# Altium schematic sheet Motor_Encoder_Sheet.SchDoc
size 420 x 297 mm; SheetNumber: 4; SheetTotal: 5
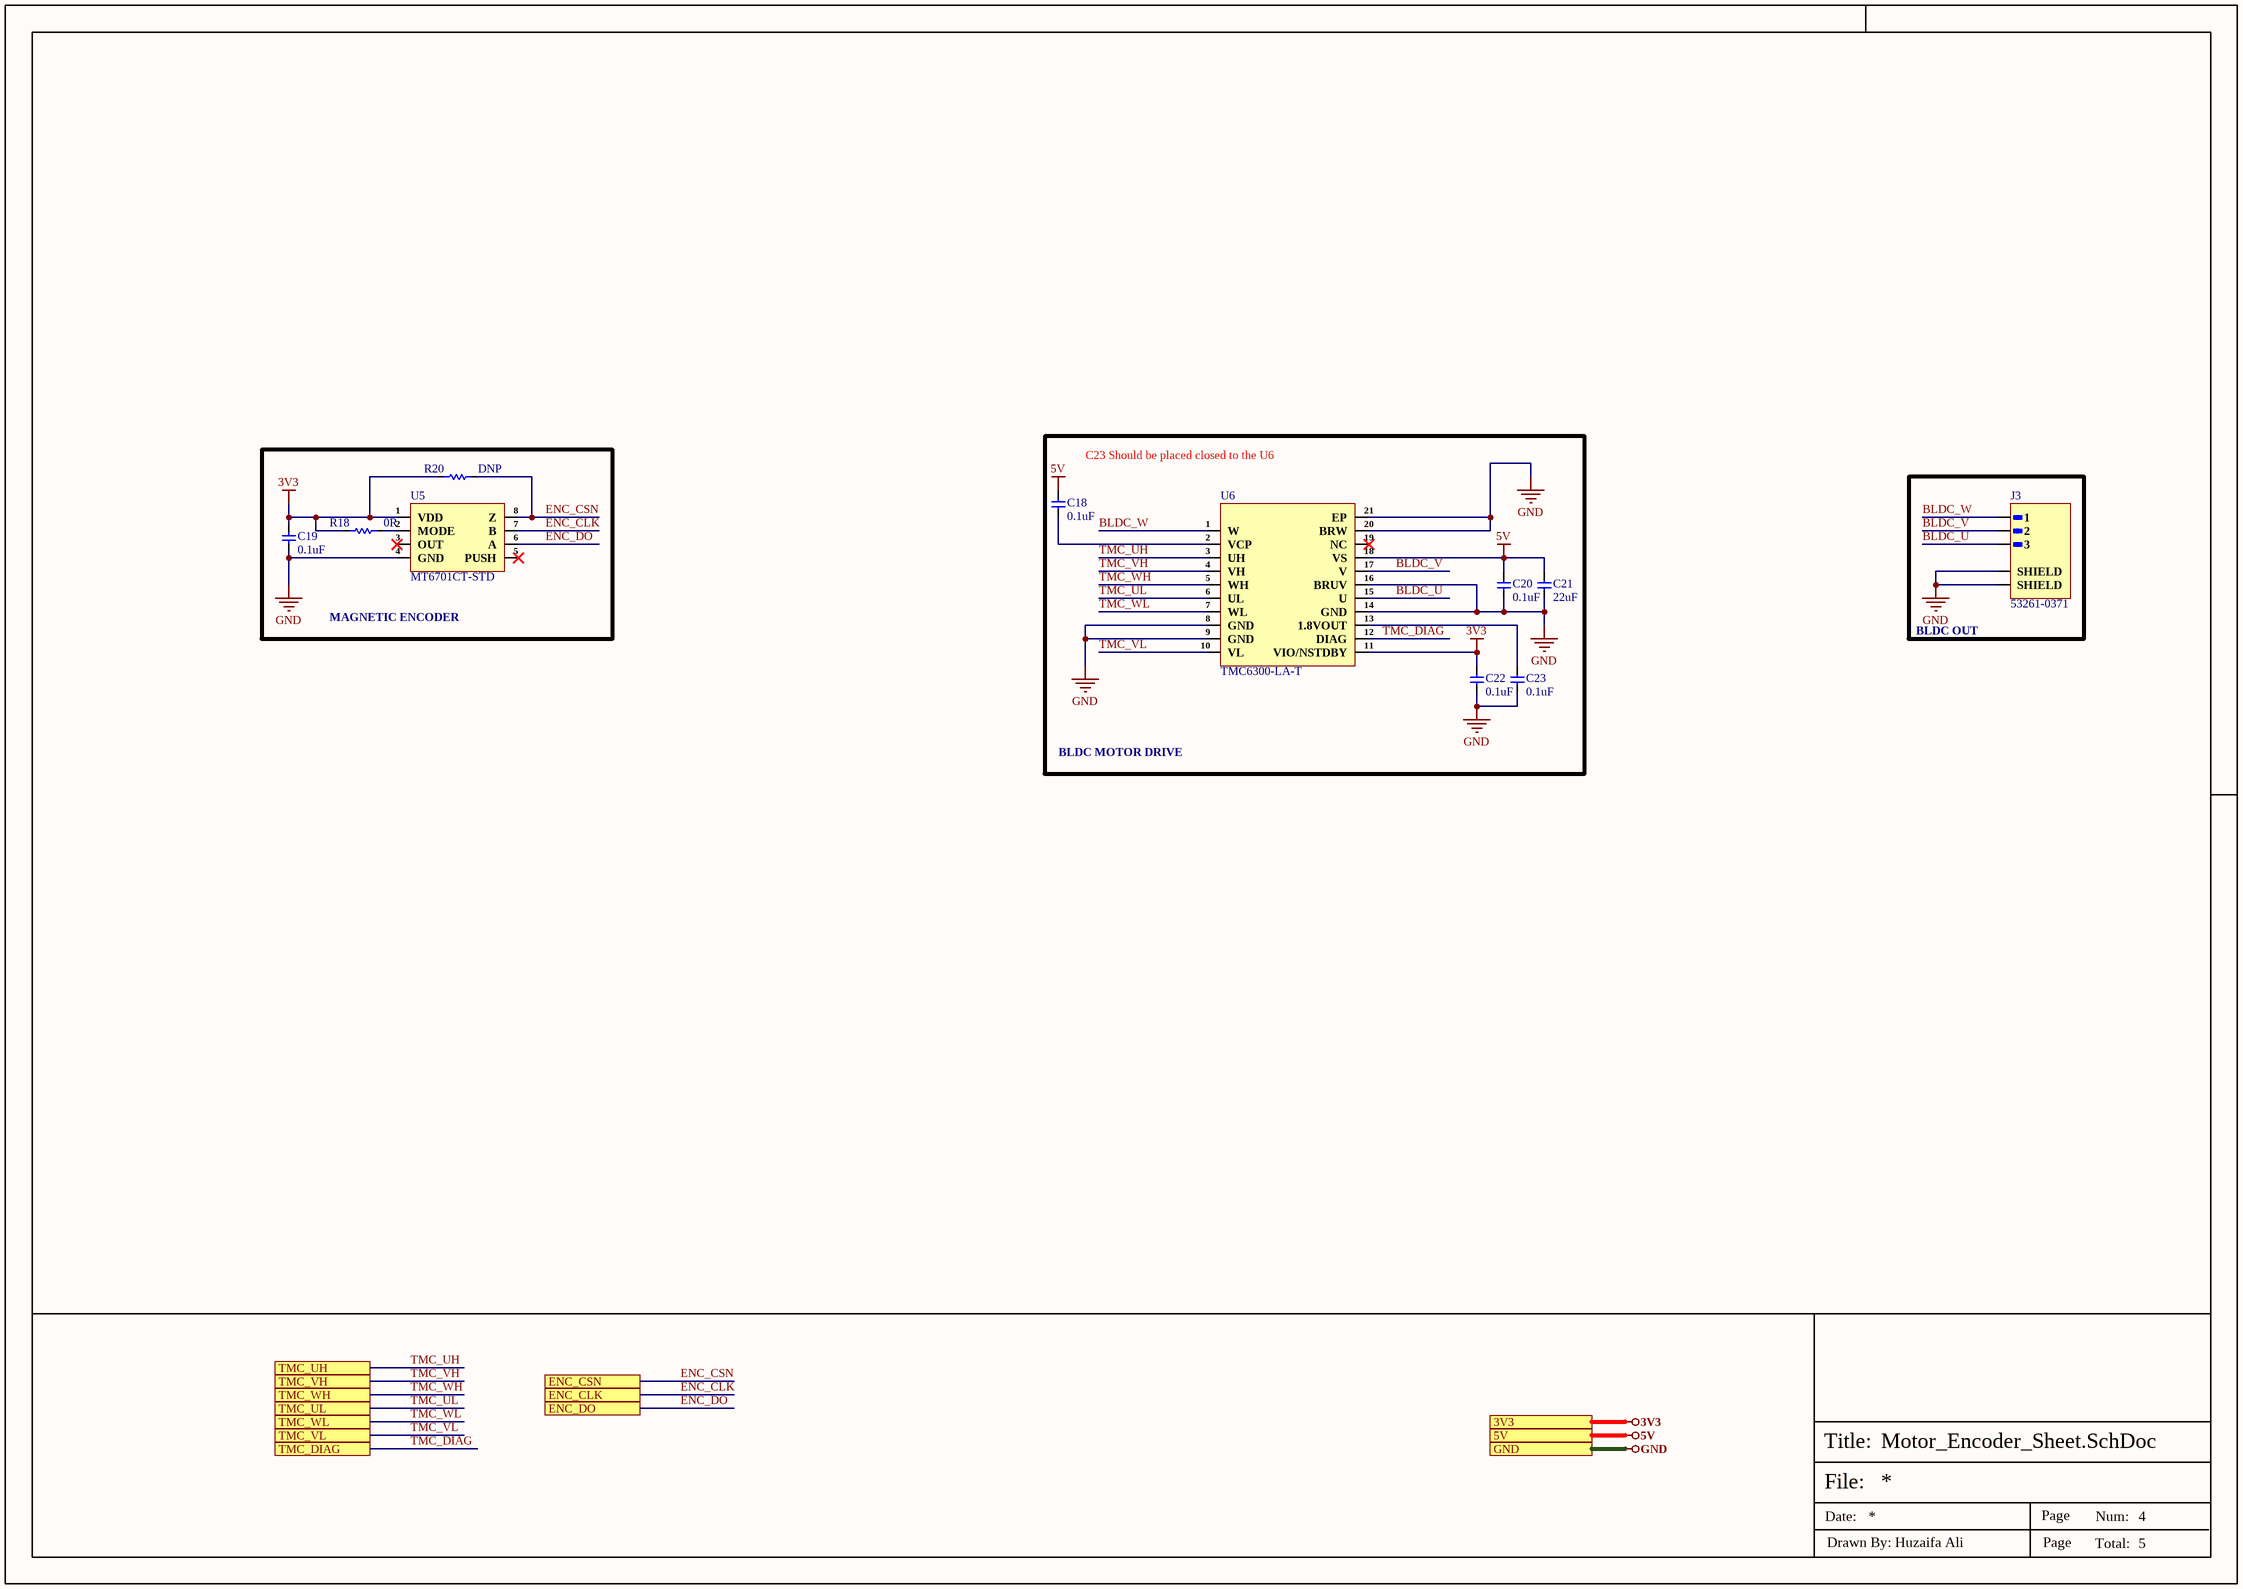
[diagram p0: Motor_Encoder_Sheet.SchDoc]

## Parts
C18  0.1uF  [Cap-0402]
C19  0.1uF  [Cap-0402]
C20  0.1uF  [Cap-0402]
C21  22uF  [Cap-1210]
C22  0.1uF  [Cap-0402]
C23  0.1uF  [Cap-0402]
J3  53261-0371  [53261-0371]
R18  0R  [Res-0603]
R20  DNP  [Res-0603]
U5  MT6701CT-STD  [SOP-8]
U6  TMC6300-LA-T  [20-QFN(3x3)]

## Blocks framed on the sheet
MAGNETIC ENCODER: C19 R18 R20 U5
BLDC OUT: J3

## Ports
3V3 (see Top_Sheet[4B], Controller_Sheet[4D], Power_Sheet[3D], RGB_LED_Sheet[4D]), 5V (see Top_Sheet[4B], Controller_Sheet[4D], Power_Sheet[3D], RGB_LED_Sheet[4D]), ENC_CLK (see Top_Sheet[4C], Controller_Sheet[2D]), ENC_CSN (see Top_Sheet[4C], Controller_Sheet[2D]), ENC_DO (see Top_Sheet[4C], Controller_Sheet[2D]), GND (see Top_Sheet[4B], Controller_Sheet[4D], Power_Sheet[3D], RGB_LED_Sheet[4D]), TMC_DIAG (see Top_Sheet[4B], Controller_Sheet[1D]), TMC_UH (see Top_Sheet[4B], Controller_Sheet[1D]), TMC_UL (see Top_Sheet[4C], Controller_Sheet[1D]), TMC_VH (see Top_Sheet[4B], Controller_Sheet[1D]), TMC_VL (see Top_Sheet[4C], Controller_Sheet[1D]), TMC_WH (see Top_Sheet[4C], Controller_Sheet[1D]), TMC_WL (see Top_Sheet[4C], Controller_Sheet[1D])

## Nets
3V3: C19.2 C22.2 R18.1 R20.1 U5.1(VDD) U6.11(VIO/NSTDBY) ; port 3V3
5V: C18.2 C20.2 C21.2 U6.18(VS) ; port 5V
GND: C19.1 C20.1 C21.1 C22.1 C23.1 J3.SH1(SHIELD) J3.SH2(SHIELD) U5.4(GND) U6.8(GND) U6.9(GND) U6.14(GND) U6.16(BRUV) U6.20(BRW) U6.21(EP) ; port GND
BLDC_U: J3.3 U6.15(U)
BLDC_V: J3.2 U6.17(V)
BLDC_W: J3.1 U6.1(W)
ENC_CLK: U5.7(B) ; port ENC_CLK
ENC_CSN: R20.2 U5.8(Z) ; port ENC_CSN
ENC_DO: U5.6(A) ; port ENC_DO
TMC_DIAG: U6.12(DIAG) ; port TMC_DIAG
TMC_UH: U6.3(UH) ; port TMC_UH
TMC_UL: U6.6(UL) ; port TMC_UL
TMC_VH: U6.4(VH) ; port TMC_VH
TMC_VL: U6.10(VL) ; port TMC_VL
TMC_WH: U6.5(WH) ; port TMC_WH
TMC_WL: U6.7(WL) ; port TMC_WL
NetC18_1: C18.1 U6.2(VCP)
NetC23_2: C23.2 U6.13(1.8VOUT)
NetR18_2: R18.2 U5.2(MODE)

Not connected (* = marked no-connect by the designer): U5 3(OUT)* 5(PUSH)*; U6 19(NC)*

## Notes on the sheet
- C23 Should be placed closed to the U6
- BLDC MOTOR DRIVE
- File:
- Title:
- Date:
- Page
- Num:
- Total:
- Drawn By: Huzaifa Ali

## Library data of the parts
C18-C20 C22 C23 = GRM155R71E104KE14D: CAP CER 0.1UF 25V X7R 0402; Manufacturer: Murata; Item Type: Capacitors; Dielectric Material: Ceramic; Material: 4241ConductorMaterial; Value: 100nF; Tolerance: 10%; Supplier: Mouser; LCSC Part Number: C77014; Manufacturer Part Number: GRM155R71E104KE14D; RoHS: Yes; Stock: 652368; Pricing: 1=0.1, 10=0.007, 50=0.007, 100=0.005, 1000=0.005, 10000=0.004 (USD); Mounting Technology: Surface Mount; Case/Package: 0402; Pins: 2NUMBER; Case Code (Metric): 1005; Case Code (Imperial): 0402; Weight: 0.000212oz; Min Operating Temperature: -55°C; Max Operating Temperature: 125°C; Packaging: Tape and Reel; Voltage Rating: 25V; Dielectric: X7R; Voltage: 25V; Termination: SMD/SMT; Voltage Rating (DC): 25V; Package Quantity: 10000; Series: GRM; Length: 1mm; Width: 0.02inch; Height: 0.5mm; Thickness: 0.022inch; Depth: 0.5mm; RoHS Compliant: Yes; Reach SVHC Compliant: Unknown; Lead Free: 5697LeadFree; ComponentLink1URL: http://www.farnell.com/datasheets/1872206.pdf?src-supplier=Farnell; ComponentLink1Description: http://www.farnell.com/datasheets/1872206.pdf?src-supplier=Farnell; ComponentLink2URL: http://www.mouser.com/ds/2/281/c02e-2905.pdf?src-supplier=Mouser; ComponentLink2Description: http://www.mouser.com/ds/2/281/c02e-2905.pdf?src-supplier=Mouser; ComponentLink3URL: http://uk.rs-online.com/webdocs/144c/0900766b8144c113.pdf?src-supplier=Rs; ComponentLink3Description: http://uk.rs-online.com/webdocs/144c/0900766b8144c113.pdf?src-supplier=Rs; ComponentLink4URL: https://datasheet.octopart.com/GRM155R71E104KE14D-Murata-datasheet-62346597.pdf?src-supplier=Future+Electronics; ComponentLink4Description: https://datasheet.octopart.com/GRM155R71E104KE14D-Murata-datasheet-62346597.pdf?src-supplier=Future+Electronics; ComponentLink5URL: https://search.murata.co.jp/Ceramy/image/img/A01X/G101/ENG/GRM155R71E104KE14-01.pdf?src-supplier=Digikey; ComponentLink5Description: https://search.murata.co.jp/Ceramy/image/img/A01X/G101/ENG/GRM155R71E104KE14-01.pdf?src-supplier=Digikey; ComponentLink6URL: http://www.farnell.com/datasheets/2048008.pdf?src-supplier=Newark; ComponentLink6Description: http://www.farnell.com/datasheets/2048008.pdf?src-supplier=Newark; ComponentLink7URL: https://datasheet.octopart.com/GRM155R71E104KE14D-Murata-datasheet-62317124.pdf?src-supplier=Element14; ComponentLink7Description: https://datasheet.octopart.com/GRM155R71E104KE14D-Murata-datasheet-62317124.pdf?src-supplier=Element14; ComponentLink8URL: http://psearch.en.murata.com/capacitor/product/GRM155R71E104KE14%23.pdf?src-supplier=Avnet; ComponentLink8Description: http://psearch.en.murata.com/capacitor/product/GRM155R71E104KE14%23.pdf?src-supplier=Avnet
C21 = GRM32ER71E226KE15L: CAP CER 22UF 25V X7R 1210; Manufacturer: Murata; Item Type: Capacitors; Color: 46Colour; Current Rating: 3A; Gender: 29Gender; Supplier: Mouser; LCSC Part Number: C21397; Manufacturer Part Number: GRM32ER71E226KE15L; RoHS: Yes; Stock: 50822; Pricing: 1=0.78, 10=0.39, 50=0.39, 100=0.351, 1000=0.297, 10000=0.267 (USD); Contact Material: 150ConductorMaterial; Contact Plating: 157ConductorMaterial; Lead Pitch: 2.54mm; Lead Free: 5697LeadFree; ComponentLink1URL: https://datasheet.ciiva.com/16497/product-16497009.pdf?src-supplier=Future+Electronics; ComponentLink1Description: https://datasheet.ciiva.com/16497/product-16497009.pdf?src-supplier=Future+Electronics; ComponentLink2URL: https://datasheet.ciiva.com/6072/1697714-6072768.pdf?src-supplier=Farnell; ComponentLink2Description: https://datasheet.ciiva.com/6072/1697714-6072768.pdf?src-supplier=Farnell; ComponentLink3URL: https://datasheet.ciiva.com/3776/2741grm32er71e226ke1523-3776996.pdf?src-supplier=Arrow+Electronics; ComponentLink3Description: https://datasheet.ciiva.com/3776/2741grm32er71e226ke1523-3776996.pdf?src-supplier=Arrow+Electronics; ComponentLink4URL: https://datasheet.ciiva.com/11789/0900766b80ef921d-11789129.pdf?src-supplier=Rs; ComponentLink4Description: https://datasheet.ciiva.com/11789/0900766b80ef921d-11789129.pdf?src-supplier=Rs; ComponentLink5URL: https://datasheet.ciiva.com/29201/451826-da-01-de-vs-kondens-grm32-er71e-226ke15l-29201795.pdf?src-supplier=Conrad; ComponentLink5Description: https://datasheet.ciiva.com/29201/451826-da-01-de-vs-kondens-grm32-er71e-226ke15l-29201795.pdf?src-supplier=Conrad; ComponentLink6URL: https://datasheet.ciiva.com/22703/1697714-22703397.pdf?src-supplier=Element14; ComponentLink6Description: https://datasheet.ciiva.com/22703/1697714-22703397.pdf?src-supplier=Element14; ComponentLink7URL: https://datasheet.ciiva.com/175/partnumbering-e-01-175746.pdf?src-supplier=Digikey; ComponentLink7Description: https://datasheet.ciiva.com/175/partnumbering-e-01-175746.pdf?src-supplier=Digikey; ComponentLink8URL: https://datasheet.ciiva.com/175/partnumbering-e-01-175747.pdf?src-supplier=Digikey; ComponentLink8Description: https://datasheet.ciiva.com/175/partnumbering-e-01-175747.pdf?src-supplier=Digikey; ComponentLink9URL: https://datasheet.ciiva.com/175/partnumbering-e-01-175748.pdf?src-supplier=Digikey; ComponentLink9Description: https://datasheet.ciiva.com/175/partnumbering-e-01-175748.pdf?src-supplier=Digikey
J3 = 53261-0371: CONN HEADER SMD R/A 3POS 1.25MM; Manufacturer: Molex; Manufacturer Series: 53261; Item Type: Headers and Wire Housings; Plating: Tin; Number of Positions: 3; Gender: Male; Contact Resistance: 20mR; Option: General Purpose; Current Rating: 1A; Voltage Rating: 125V; Mixed Contacts: No; Number of Rows Loaded: 1; Insulation Resistance: 100MR; Number of Circuits: 2; Glow Wire Compliant: Non-compliant; Supplier: Arrow Electronics; LCSC Part Number: C293630; Manufacturer Part Number: 53261-0371; RoHS: Yes; Stock: 442600; Pricing: 1600=0.3964 (USD); Mounting Technology: Surface Mount,Board; Contact Plating: Tin; Contact Material: Bronze,Tin; Color: Natural; Housing Color: Natural; Housing Material: Nylon; Min Operating Temperature: -40°C; Max Operating Temperature: 85°C; Termination: Solder; Orientation: Right Angle; Number of Rows: 1; Packaging: Tape and Reel; Number of Contacts: 3; Series: PicoBlade; Contact Type: Blade Pin; Contact Gender: Male; Mounting Style: STRAIGHT; Filter Feature: No; Voltage Rating (AC): 125V; Working Voltage: 125V; Voltage Rating (DC): 125V; Length: 8.9mm; Pitch: 1.25mm; Depth: 5.2mm; Radiation Hardening: No; Flammability Rating: UL94 V-0; MIL Conformance: No; DIN Conformance: No; IEC Conformance: No; RoHS Compliant: Yes; Reach SVHC Compliant: Unknown; Lead Free: Lead Free; ComponentLink1URL: https://datasheet.ciiva.com/3932/333250532610371-pcb-headers-3932824.pdf?src-supplier=Arrow+Electronics; ComponentLink1Description: https://datasheet.ciiva.com/3932/333250532610371-pcb-headers-3932824.pdf?src-supplier=Arrow+Electronics; ComponentLink2URL: https://datasheet.ciiva.com/34302/1302094-34302177.pdf?src-supplier=Jameco; ComponentLink2Description: https://datasheet.ciiva.com/34302/1302094-34302177.pdf?src-supplier=Jameco
R18 R20 = RC0603JR-070RL: RES 0 OHM JUMPER 1/10W 0603; Manufacturer: Yageo; Resistance: 0mR; Tolerance: 1%; Power Rating: 100mW; Voltage Rating (DC): 50V; Temperature Coefficient: 200ppm/°C; Resistance Tolerance: 5%; Item Type: Resistor; Supplier 1: Digi-Key; Manufacturer Part Number: RC0603JR-070RL; RoHS: Yes; Category: Chip SMD Resistors; Stock 1: 18081776; Pricing 1: 1=0.10000, 10=0.01700, 25=0.01240, 50=0.00960, 100=0.00700, 250=0.00536, 500=0.00430, 1000=0.00316 (USD); Case/Package: 0603; Number of Pins: 2; Contact Plating: Tin,Matte; Case Code (Imperial): 0603; Case Code (Metric): 1608; Size Code: 0603; Min Operating Temperature: -55°C; Max Operating Temperature: 155°C; Resistor Type: Thick Film; Packaging: Tape and Reel; Termination: SMD/SMT; Series: RC; Technology: THICK FILM; Package Quantity: 5000; Voltage Rating: 50V; Features: Moisture Resistant; Max Power Dissipation: 100mW; Number of Terminations: 2; Construction: Rectangular; Length: 1.6mm; Width: 0.8mm; Height: 0.45mm; Depth: 0.8mm; Radiation Hardening: No; Reach SVHC Compliant: No SVHC; Lead Free: Lead Free; RoHS Compliant: Yes; Military Standard: Not; Supplier Part Number 1: 311-0.0GRCT-ND; LCSC Part Number: C95177
U5 = MT6701CT-STD: SOP-8 Position Sensors ROHS; Manufacturer: Magn Tek; Item Type: Sensor; Manufacturer Part Number: MT6701CT-STD; Package: SOP-8; LCSC Part Number: C5451785; ComponentLink1Description: LCSC; ComponentLink1URL: https://www.lcsc.com/product-detail/Position-Sensors_Magn-Tek-MT6701CT-STD_C5451785.html?s_z=n_mt6701ct
U6 = TMC6300-LA-T: BLDC MOTOR DRIVER 2-11V QFN20; Manufacturer: Trinamic; Item Type: IC; Supplier: Mouser; LCSC Part Number: C5274455; Manufacturer Part Number: TMC6300-LA-T; RoHS: No; Pricing: 1=3.73, 10=2.47, 50=2.11, 100=1.71, 1000=1.28, 10000=1.15 (USD); Series: -